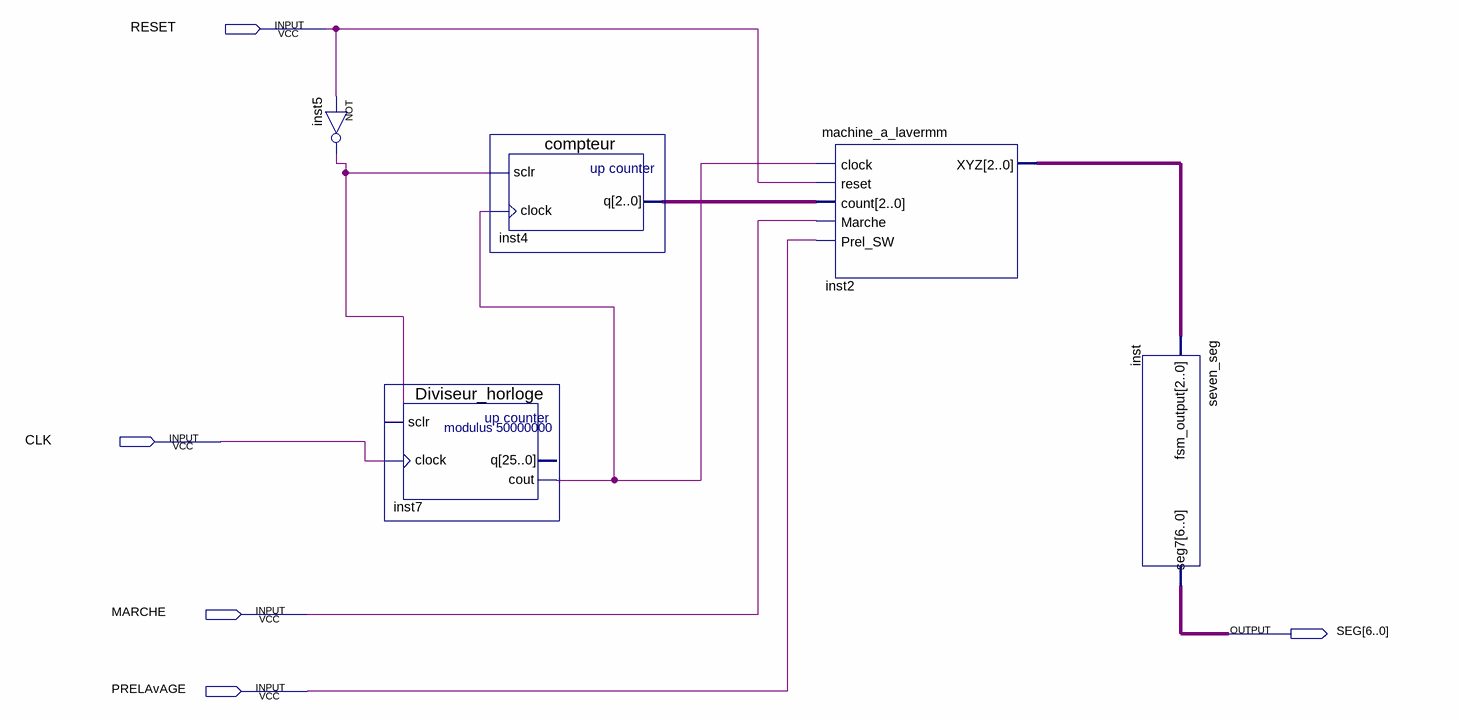
[diagram p0: schematic sheet]
// Quartus schematic schemaBlockmachineAlaver.bdf as structural Verilog: 5 symbols, 5 pins
module schemaBlockmachineAlaver (
  input  RESET,
  input  CLK,
  input  MARCHE,
  input  PRELAvAGE,
  output [6:0] SEG
);

  wire inst5_out, inst7_cout;
  wire [2:0] inst2_xyz, inst4_q;

  not inst5 (inst5_out, RESET);
  Diviseur_horloge inst7 (.sclr(inst5_out), .clock(CLK), .cout(inst7_cout));  // open: q
  compteur inst4 (.sclr(inst5_out), .clock(inst7_cout), .q(inst4_q));
  machine_a_lavermm inst2 (
    .clock(inst7_cout), .reset(RESET), .count(inst4_q), .Marche(MARCHE), .Prel_SW(PRELAvAGE), .XYZ(inst2_xyz));
  seven_seg inst (.fsm_output(inst2_xyz), .seg7(SEG));
endmodule
